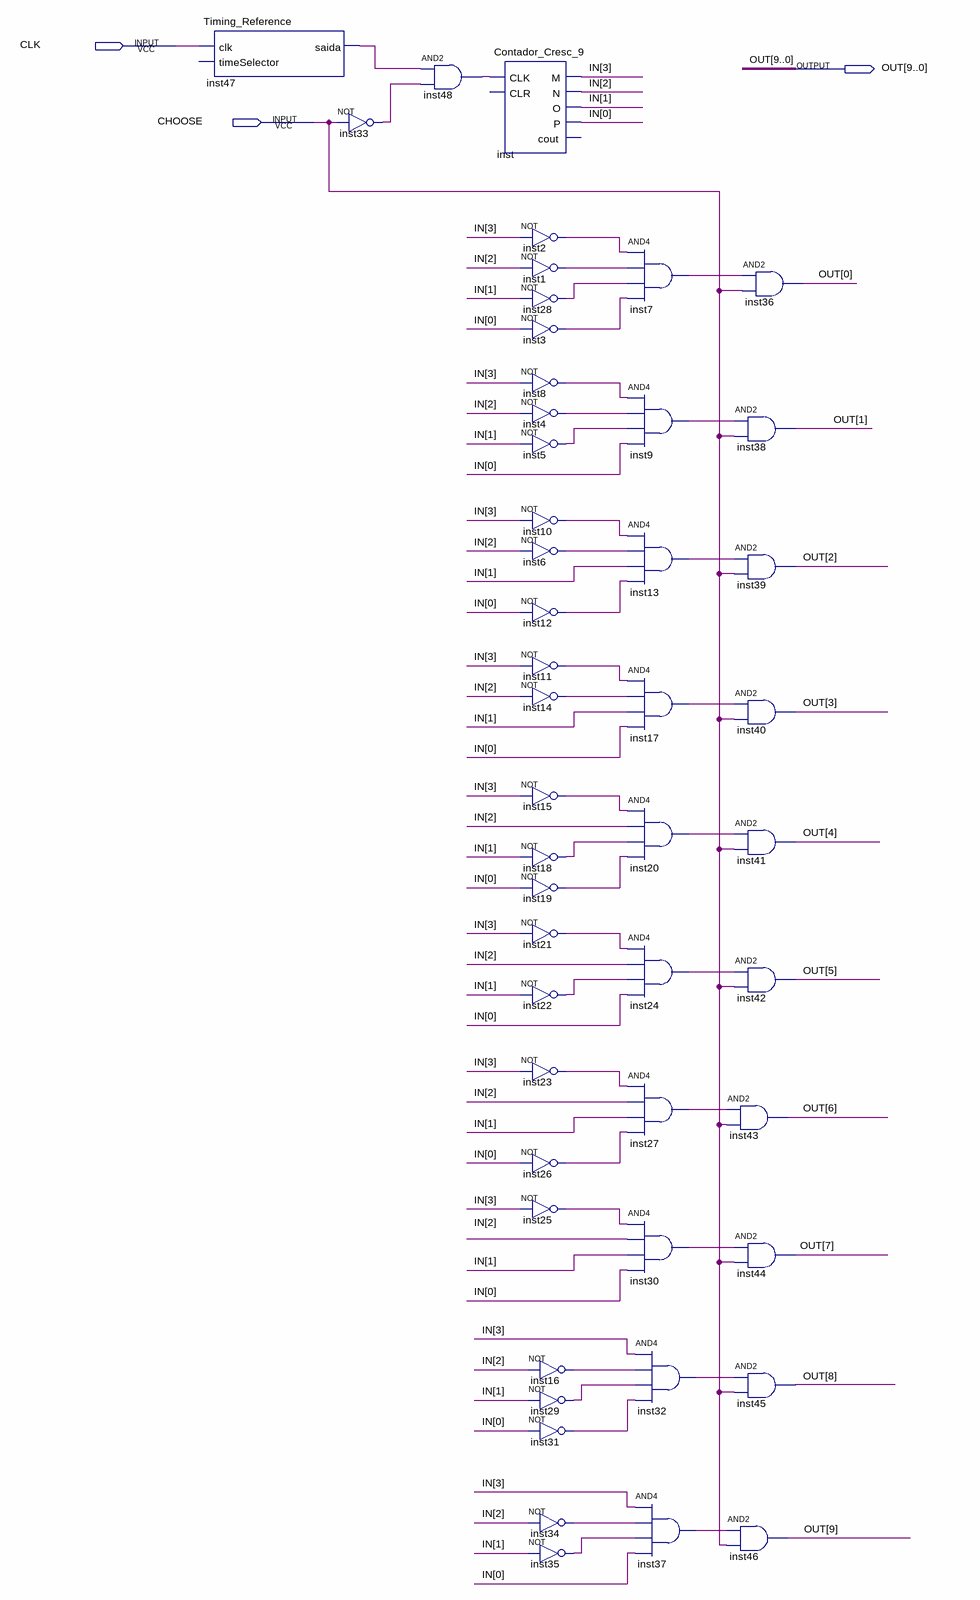
[diagram p0: schematic sheet]
// Quartus schematic Deliberate.bdf as structural Verilog: 49 symbols, 3 pins
module Deliberate (
  input  CLK,
  input  CHOOSE,
  output [9:0] OUT
);

  wire inst1_out, inst2_out, inst3_out, inst4_out, inst5_out, inst6_out, inst7_out, inst8_out, inst9_out,
       inst10_out, inst11_out, inst12_out, inst13_out, inst14_out, inst15_out, inst16_out, inst17_out,
       inst18_out, inst19_out, inst20_out, inst21_out, inst22_out, inst23_out, inst24_out, inst25_out,
       inst26_out, inst27_out, inst28_out, inst29_out, inst30_out, inst31_out, inst32_out, inst33_out,
       inst34_out, inst35_out, inst37_out, inst47_saida, inst48_out;
  wire [3:0] IN;

  Timing_Reference inst47 (.clk(CLK), .saida(inst47_saida));  // open: timeSelector
  not inst33 (inst33_out, CHOOSE);
  and inst48 (inst48_out, inst47_saida, inst33_out);
  Contador_Cresc_9 inst (.CLK(inst48_out), .M(IN[3]), .N(IN[2]), .O(IN[1]), .P(IN[0]));  // open: CLR, cout
  not inst2 (inst2_out, IN[3]);
  not inst1 (inst1_out, IN[2]);
  not inst28 (inst28_out, IN[1]);
  not inst3 (inst3_out, IN[0]);
  not inst8 (inst8_out, IN[3]);
  not inst4 (inst4_out, IN[2]);
  not inst5 (inst5_out, IN[1]);
  not inst10 (inst10_out, IN[3]);
  not inst6 (inst6_out, IN[2]);
  not inst12 (inst12_out, IN[0]);
  not inst11 (inst11_out, IN[3]);
  not inst14 (inst14_out, IN[2]);
  not inst15 (inst15_out, IN[3]);
  not inst18 (inst18_out, IN[1]);
  not inst19 (inst19_out, IN[0]);
  not inst21 (inst21_out, IN[3]);
  not inst22 (inst22_out, IN[1]);
  not inst23 (inst23_out, IN[3]);
  not inst26 (inst26_out, IN[0]);
  not inst25 (inst25_out, IN[3]);
  not inst16 (inst16_out, IN[2]);
  not inst29 (inst29_out, IN[1]);
  not inst31 (inst31_out, IN[0]);
  not inst34 (inst34_out, IN[2]);
  not inst35 (inst35_out, IN[1]);
  and inst7 (inst7_out, inst2_out, inst1_out, inst28_out, inst3_out);
  and inst9 (inst9_out, inst8_out, inst4_out, inst5_out, IN[0]);
  and inst13 (inst13_out, inst10_out, inst6_out, IN[1], inst12_out);
  and inst17 (inst17_out, inst11_out, inst14_out, IN[1], IN[0]);
  and inst20 (inst20_out, inst15_out, IN[2], inst18_out, inst19_out);
  and inst24 (inst24_out, inst21_out, IN[2], inst22_out, IN[0]);
  and inst27 (inst27_out, inst23_out, IN[2], IN[1], inst26_out);
  and inst30 (inst30_out, inst25_out, IN[2], IN[1], IN[0]);
  and inst32 (inst32_out, IN[3], inst16_out, inst29_out, inst31_out);
  and inst37 (inst37_out, IN[3], inst34_out, inst35_out, IN[0]);
  and inst36 (OUT[0], inst7_out, CHOOSE);
  and inst38 (OUT[1], inst9_out, CHOOSE);
  and inst39 (OUT[2], inst13_out, CHOOSE);
  and inst40 (OUT[3], inst17_out, CHOOSE);
  and inst41 (OUT[4], inst20_out, CHOOSE);
  and inst42 (OUT[5], inst24_out, CHOOSE);
  and inst43 (OUT[6], inst27_out, CHOOSE);
  and inst44 (OUT[7], inst30_out, CHOOSE);
  and inst45 (OUT[8], inst32_out, CHOOSE);
  and inst46 (OUT[9], inst37_out, CHOOSE);
endmodule
